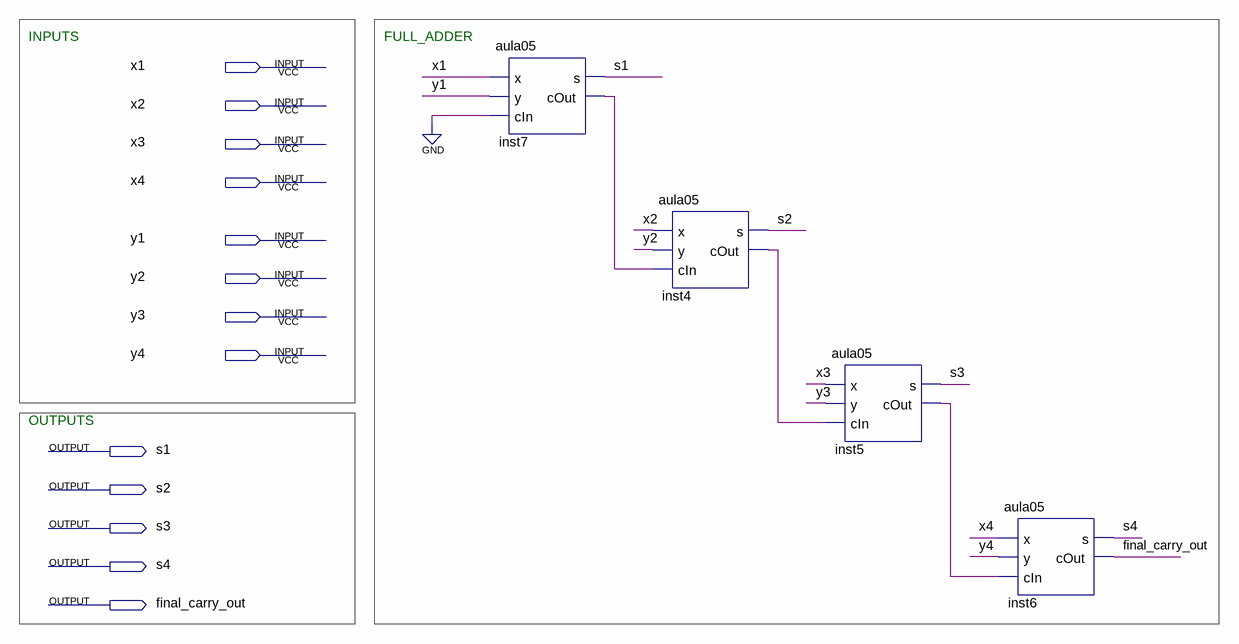
[diagram p0: schematic sheet]
// Quartus schematic aula06.bdf as structural Verilog: 4 symbols, 13 pins
module aula06 (
  input  x1,
  input  x2,
  input  x3,
  input  x4,
  input  y1,
  input  y2,
  input  y3,
  input  y4,
  output s1,
  output s2,
  output s3,
  output s4,
  output final_carry_out
);

  wire inst4_cout, inst5_cout, inst7_cout;

  aula05 inst7 (.x(x1), .y(y1), .cIn(1'b0), .s(s1), .cOut(inst7_cout));
  aula05 inst4 (.x(x2), .y(y2), .cIn(inst7_cout), .s(s2), .cOut(inst4_cout));
  aula05 inst5 (.x(x3), .y(y3), .cIn(inst4_cout), .s(s3), .cOut(inst5_cout));
  aula05 inst6 (.x(x4), .y(y4), .cIn(inst5_cout), .s(s4), .cOut(final_carry_out));

  // Notes on the sheet:
  //   INPUTS
  //   FULL_ADDER
  //   OUTPUTS
endmodule
